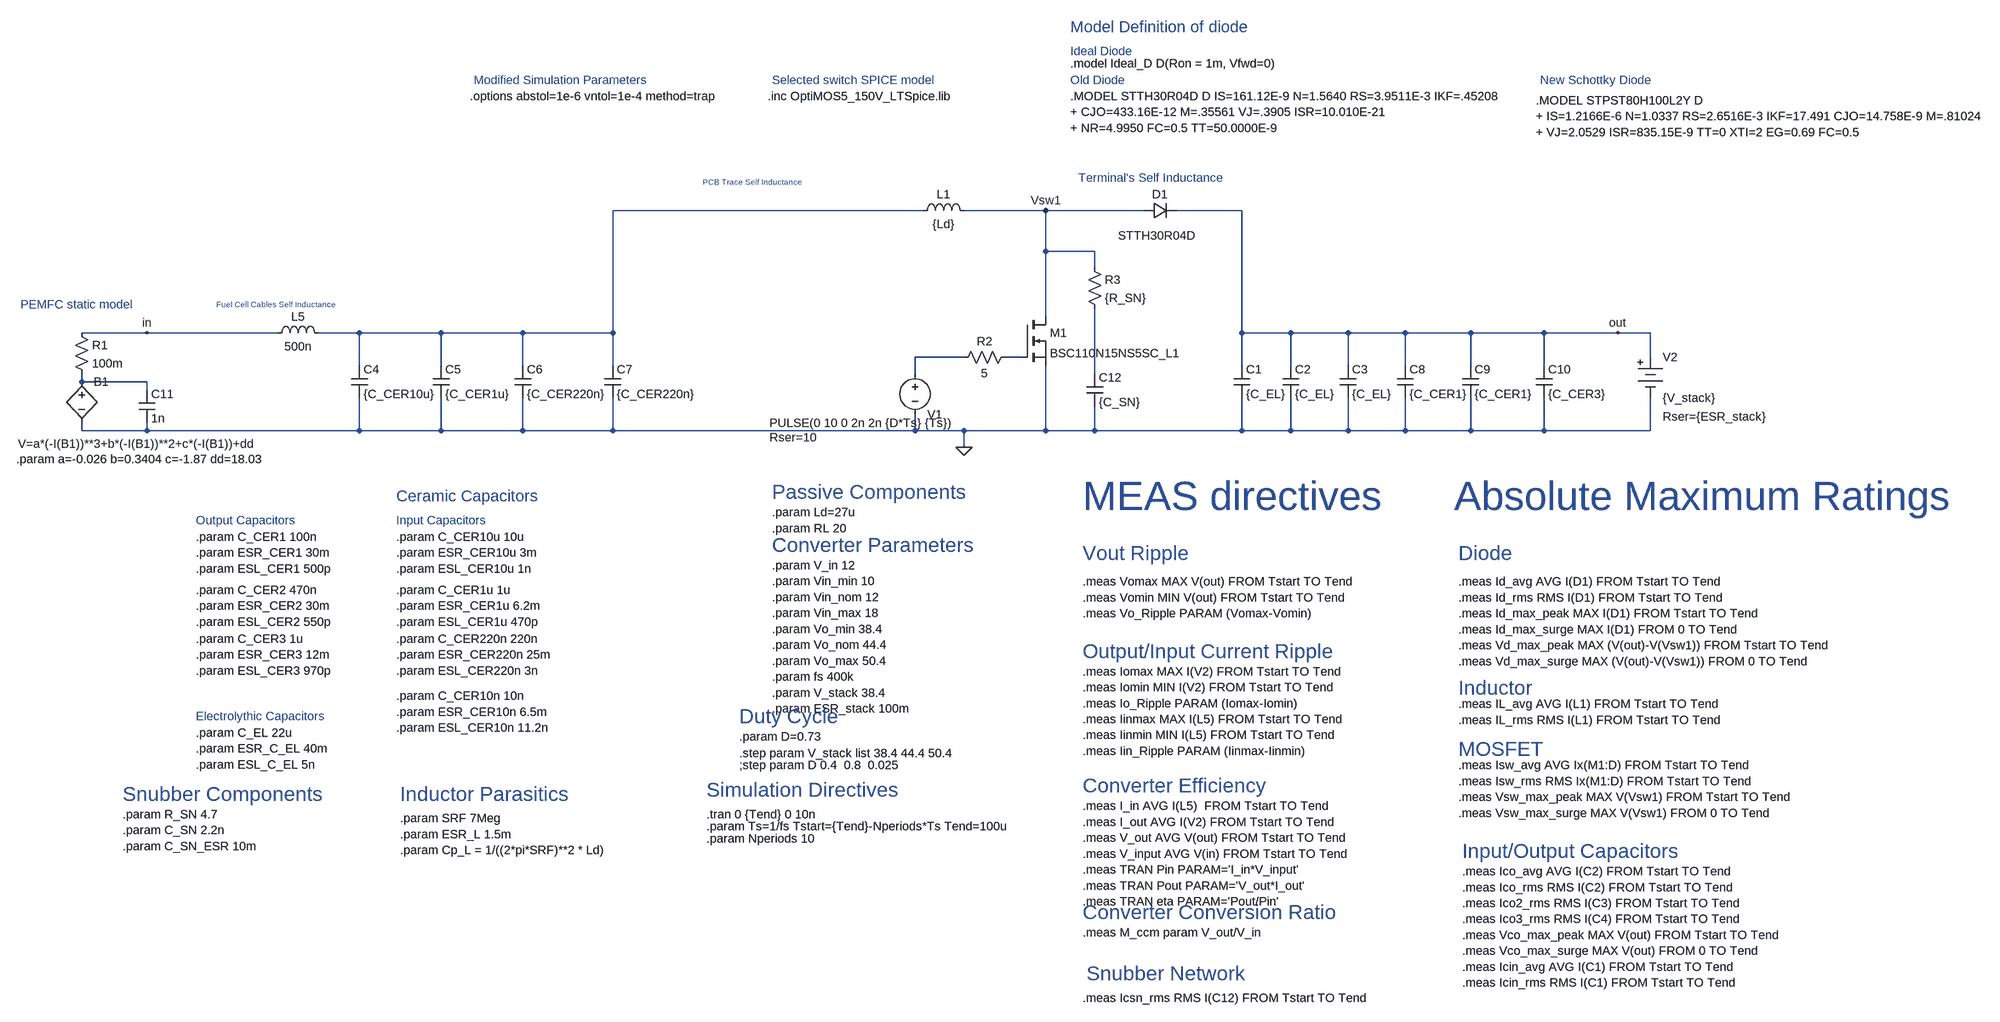
[diagram p0: schematic boost_snubber.asc]
boost_snubber.asc, the LTspice schematic file:
Version 4.1
SHEET 1 1944 1432
WIRE -208 -128 -816 -128
WIRE 32 -128 -128 -128
WIRE 224 -128 32 -128
WIRE 416 -128 288 -128
WIRE 32 -48 32 -128
WIRE 128 -48 32 -48
WIRE 128 -16 128 -48
WIRE 32 80 32 -48
WIRE -1728 112 -1856 112
WIRE -1472 112 -1728 112
WIRE -1312 112 -1392 112
WIRE -1152 112 -1312 112
WIRE -992 112 -1152 112
WIRE -816 112 -816 -128
WIRE -816 112 -992 112
WIRE 416 112 416 -128
WIRE 512 112 416 112
WIRE 624 112 512 112
WIRE 736 112 624 112
WIRE 864 112 736 112
WIRE 1008 112 864 112
WIRE 1152 112 1008 112
WIRE 1216 112 1152 112
WIRE -128 160 -224 160
WIRE -16 160 -48 160
WIRE 1216 160 1216 112
WIRE -1312 176 -1312 112
WIRE -1152 176 -1152 112
WIRE -992 176 -992 112
WIRE -816 176 -816 112
WIRE 416 176 416 112
WIRE 512 176 512 112
WIRE 624 176 624 112
WIRE 736 176 736 112
WIRE 864 176 864 112
WIRE 1008 176 1008 112
WIRE -224 192 -224 160
WIRE 128 192 128 64
WIRE -1856 208 -1856 192
WIRE -1728 208 -1856 208
WIRE -1728 224 -1728 208
WIRE -1856 304 -1856 288
WIRE -1728 304 -1728 288
WIRE -1728 304 -1856 304
WIRE -1312 304 -1312 240
WIRE -1312 304 -1728 304
WIRE -1152 304 -1152 240
WIRE -1152 304 -1312 304
WIRE -992 304 -992 240
WIRE -992 304 -1152 304
WIRE -816 304 -816 240
WIRE -816 304 -992 304
WIRE -224 304 -224 272
WIRE -224 304 -816 304
WIRE -128 304 -224 304
WIRE 32 304 32 176
WIRE 32 304 -128 304
WIRE 128 304 128 256
WIRE 128 304 32 304
WIRE 416 304 416 240
WIRE 416 304 128 304
WIRE 512 304 512 240
WIRE 512 304 416 304
WIRE 624 304 624 240
WIRE 624 304 512 304
WIRE 736 304 736 240
WIRE 736 304 624 304
WIRE 864 304 864 240
WIRE 864 304 736 304
WIRE 1008 304 1008 240
WIRE 1008 304 864 304
WIRE 1216 304 1216 240
WIRE 1216 304 1008 304
WIRE -128 336 -128 304
FLAG -128 336 0
FLAG 1152 112 out
FLAG 32 -128 Vsw1
FLAG -1728 112 in
SYMBOL ind -224 -112 R270
WINDOW 0 32 56 VTop 2
WINDOW 3 5 56 VBottom 2
SYMATTR InstName L1
SYMATTR Value {Ld}
SYMATTR SpiceLine Rser={ESR_L} Cpar={Cp_L}
SYMBOL diode 224 -112 R270
WINDOW 0 32 32 VTop 2
WINDOW 3 -18 25 VBottom 2
SYMATTR InstName D1
SYMATTR Value STTH30R04D
SYMBOL voltage -224 176 R0
WINDOW 0 24 96 Left 2
WINDOW 3 -285 113 Left 2
WINDOW 123 0 0 Left 0
WINDOW 39 -285 141 Left 2
SYMATTR InstName V1
SYMATTR Value PULSE(0 10 0 2n 2n {D*Ts} {Ts})
SYMATTR SpiceLine Rser=10
SYMBOL res -32 144 R90
WINDOW 0 0 56 VBottom 2
WINDOW 3 32 56 VTop 2
SYMATTR InstName R2
SYMATTR Value 5
SYMBOL cap 496 176 R0
SYMATTR InstName C2
SYMATTR Value {C_EL}
SYMATTR SpiceLine Rser={ESR_C_EL} Lser={ESL_C_EL}
SYMBOL cap 400 176 R0
SYMATTR InstName C1
SYMATTR Value {C_EL}
SYMATTR SpiceLine Rser={ESR_C_EL} Lser={ESL_C_EL}
SYMBOL cap 608 176 R0
SYMATTR InstName C3
SYMATTR Value {C_EL}
SYMATTR SpiceLine Rser={ESR_C_EL} Lser={ESL_C_EL}
SYMBOL cap -1328 176 R0
SYMATTR InstName C4
SYMATTR Value {C_CER10u}
SYMATTR SpiceLine Rser={ESR_CER10u} Lser={ESL_CER10u}
SYMBOL cap -1168 176 R0
SYMATTR InstName C5
SYMATTR Value {C_CER1u}
SYMATTR SpiceLine Rser={ESR_CER1u} Lser={ESL_CER1u}
SYMBOL cap -1008 176 R0
SYMATTR InstName C6
SYMATTR Value {C_CER220n}
SYMATTR SpiceLine Rser={ESR_CER220n} Lser={ESL_CER220n}
SYMBOL cap -832 176 R0
SYMATTR InstName C7
SYMATTR Value {C_CER220n}
SYMATTR SpiceLine Rser={ESR_CER220n} Lser={ESL_CER220n}
SYMBOL cap 720 176 R0
SYMATTR InstName C8
SYMATTR Value {C_CER1}
SYMATTR SpiceLine Rser={ESR_CER1} Lser={ESL_CER1}
SYMBOL cap 992 176 R0
SYMATTR InstName C10
SYMATTR Value {C_CER3}
SYMATTR SpiceLine Rser={ESR_CER3} Lser={ESL_CER3}
SYMBOL ind -1488 128 R270
WINDOW 0 32 56 VTop 2
WINDOW 3 5 56 VBottom 2
SYMATTR InstName L5
SYMATTR Value 500n
SYMBOL cap 848 176 R0
SYMATTR InstName C9
SYMATTR Value {C_CER1}
SYMATTR SpiceLine Rser={ESR_CER1} Lser={ESL_CER1}
SYMBOL Misc\\battery 1216 144 R0
WINDOW 123 0 0 Left 0
WINDOW 39 24 132 Left 2
SYMATTR SpiceLine Rser={ESR_stack}
SYMATTR InstName V2
SYMATTR Value {V_stack}
SYMBOL bv -1856 192 R0
WINDOW 3 -125 138 Left 2
SYMATTR Value V=a*(-I(B1))**3+b*(-I(B1))**2+c*(-I(B1))+dd
SYMATTR InstName B1
SYMBOL res -1872 96 R0
SYMATTR InstName R1
SYMATTR Value 100m
SYMBOL cap -1744 224 R0
SYMATTR InstName C11
SYMATTR Value 1n
SYMBOL res 112 -32 R0
SYMATTR InstName R3
SYMATTR Value {R_SN}
SYMBOL cap 112 192 R0
SYMATTR InstName C12
SYMATTR Value {C_SN}
SYMATTR SpiceLine Rser={C_SN_ESR}
SYMBOL nmos -16 80 R0
SYMATTR InstName M1
SYMATTR Value BSC110N15NS5SC_L1
SYMATTR Prefix X
TEXT -504 464 Left 2 !.param Ld=27u\n.param RL 20
TEXT -632 1056 Left 2 !.tran 0 {Tend} 0 10n
TEXT -632 1080 Left 2 !.param Ts=1/fs Tstart={Tend}-Nperiods*Ts Tend=100u
TEXT 80 -352 Left 2 !.MODEL STTH30R04D D IS=161.12E-9 N=1.5640 RS=3.9511E-3 IKF=.45208\n+ CJO=433.16E-12 M=.35561 VJ=.3905 ISR=10.010E-21\n+ NR=4.9950 FC=0.5 TT=50.0000E-9
TEXT 80 -488 Left 3 ;Model Definition of diode
TEXT -568 960 Left 2 !;step param D 0.4  0.8  0.025
TEXT -504 568 Left 2 !.param V_in 12\n.param Vin_min 10\n.param Vin_nom 12\n.param Vin_max 18\n.param Vo_min 38.4\n.param Vo_nom 44.4\n.param Vo_max 50.4\n.param fs 400k\n.param V_stack 38.4\n.param ESR_stack 100m
TEXT -504 424 Left 4 ;Passive Components
TEXT -504 528 Left 4 ;Converter Parameters
TEXT 840 600 Left 2 !.meas Id_avg AVG I(D1) FROM Tstart TO Tend\n.meas Id_rms RMS I(D1) FROM Tstart TO Tend\n.meas Id_max_peak MAX I(D1) FROM Tstart TO Tend\n.meas Id_max_surge MAX I(D1) FROM 0 TO Tend\n.meas Vd_max_peak MAX (V(out)-V(Vsw1)) FROM Tstart TO Tend\n.meas Vd_max_surge MAX (V(out)-V(Vsw1)) FROM 0 TO Tend
TEXT 832 432 Left 6 ;Absolute Maximum Ratings
TEXT 840 544 Left 4 ;Diode
TEXT 840 840 Left 2 !.meas IL_avg AVG I(L1) FROM Tstart TO Tend\n.meas IL_rms RMS I(L1) FROM Tstart TO Tend
TEXT 840 808 Left 4 ;Inductor
TEXT 840 960 Left 2 !.meas Isw_avg AVG Ix(M1:D) FROM Tstart TO Tend\n.meas Isw_rms RMS Ix(M1:D) FROM Tstart TO Tend\n.meas Vsw_max_peak MAX V(Vsw1) FROM Tstart TO Tend\n.meas Vsw_max_surge MAX V(Vsw1) FROM 0 TO Tend
TEXT 840 928 Left 4 ;MOSFET
TEXT 848 1168 Left 2 !.meas Ico_avg AVG I(C2) FROM Tstart TO Tend\n.meas Ico_rms RMS I(C2) FROM Tstart TO Tend\n.meas Ico2_rms RMS I(C3) FROM Tstart TO Tend\n.meas Ico3_rms RMS I(C4) FROM Tstart TO Tend\n.meas Vco_max_peak MAX V(out) FROM Tstart TO Tend\n.meas Vco_max_surge MAX V(out) FROM 0 TO Tend\n.meas Icin_avg AVG I(C1) FROM Tstart TO Tend\n.meas Icin_rms RMS I(C1) FROM Tstart TO Tend
TEXT 848 1128 Left 4 ;Input/Output Capacitors
TEXT -568 864 Left 4 ;Duty Cycle
TEXT 104 432 Left 6 ;MEAS directives
TEXT 104 544 Left 4 ;Vout Ripple
TEXT 104 600 Left 2 !.meas Vomax MAX V(out) FROM Tstart TO Tend\n.meas Vomin MIN V(out) FROM Tstart TO Tend\n.meas Vo_Ripple PARAM (Vomax-Vomin)
TEXT 104 736 Left 4 ;Output/Input Current Ripple
TEXT 104 776 Left 2 !.meas Iomax MAX I(V2) FROM Tstart TO Tend\n.meas Iomin MIN I(V2) FROM Tstart TO Tend\n.meas Io_Ripple PARAM (Iomax-Iomin)\n.meas Iinmax MAX I(L5) FROM Tstart TO Tend\n.meas Iinmin MIN I(L5) FROM Tstart TO Tend\n.meas Iin_Ripple PARAM (Iinmax-Iinmin)
TEXT 104 1040 Left 2 !.meas I_in AVG I(L5)  FROM Tstart TO Tend\n.meas I_out AVG I(V2) FROM Tstart TO Tend\n.meas V_out AVG V(out) FROM Tstart TO Tend\n.meas V_input AVG V(in) FROM Tstart TO Tend\n.meas TRAN Pin PARAM='I_in*V_input'\n.meas TRAN Pout PARAM='V_out*I_out'\n.meas TRAN eta PARAM='Pout/Pin'
TEXT 104 1000 Left 4 ;Converter Efficiency
TEXT 104 1248 Left 4 ;Converter Conversion Ratio
TEXT 104 1288 Left 2 !.meas M_ccm param V_out/V_in
TEXT -632 1008 Left 4 ;Simulation Directives
TEXT -1232 1016 Left 4 ;Inductor Parasitics
TEXT -632 1104 Left 2 !.param Nperiods 10
TEXT 80 -416 Left 2 !.model Ideal_D D(Ron = 1m, Vfwd=0)
TEXT -1240 432 Left 3 ;Ceramic Capacitors
TEXT -1632 896 Left 2 !.param C_EL 22u\n.param ESR_C_EL 40m\n.param ESL_C_EL 5n
TEXT -1632 864 Left 2 ;Electrolythic Capacitors
TEXT -1240 480 Left 2 ;Input Capacitors
TEXT -1240 512 Left 2 !.param C_CER10u 10u\n.param ESR_CER10u 3m\n.param ESL_CER10u 1n
TEXT -1240 616 Left 2 !.param C_CER1u 1u\n.param ESR_CER1u 6.2m\n.param ESL_CER1u 470p
TEXT -1240 712 Left 2 !.param C_CER220n 220n\n.param ESR_CER220n 25m\n.param ESL_CER220n 3n
TEXT -1240 824 Left 2 !.param C_CER10n 10n\n.param ESR_CER10n 6.5m\n.param ESL_CER10n 11.2n
TEXT -1632 512 Left 2 !.param C_CER1 100n\n.param ESR_CER1 30m\n.param ESL_CER1 500p
TEXT -1632 480 Left 2 ;Output Capacitors
TEXT -1632 616 Left 2 !.param C_CER2 470n\n.param ESR_CER2 30m\n.param ESL_CER2 550p
TEXT -1632 712 Left 2 !.param C_CER3 1u\n.param ESR_CER3 12m\n.param ESL_CER3 970p
TEXT -1232 1064 Left 2 !.param SRF 7Meg\n.param ESR_L 1.5m\n.param Cp_L = 1/((2*pi*SRF)**2 * Ld)
TEXT -640 -184 Left 1 ;PCB Trace Self Inductance
TEXT 96 -192 Left 2 ;Terminal's Self Inductance
TEXT -1592 56 Left 1 ;Fuel Cell Cables Self Inductance
TEXT 80 -384 Left 2 ;Old Diode
TEXT 1000 -384 Left 2 ;New Schottky Diode
TEXT 992 -344 Left 2 !.MODEL STPST80H100L2Y D\n+ IS=1.2166E-6 N=1.0337 RS=2.6516E-3 IKF=17.491 CJO=14.758E-9 M=.81024\n+ VJ=2.0529 ISR=835.15E-9 TT=0 XTI=2 EG=0.69 FC=0.5
TEXT -1096 -352 Left 2 !.options abstol=1e-6 vntol=1e-4 method=trap
TEXT -1088 -384 Left 2 ;Modified Simulation Parameters
TEXT -504 -384 Left 2 ;Selected switch SPICE model
TEXT 80 -440 Left 2 ;Ideal Diode
TEXT -568 936 Left 2 !.step param V_stack list 38.4 44.4 50.4
TEXT -1984 360 Left 2 !.param a=-0.026 b=0.3404 c=-1.87 dd=18.03
TEXT -568 904 Left 2 !.param D=0.73
TEXT -1976 56 Left 2 ;PEMFC static model
TEXT -512 -352 Left 2 !.inc OptiMOS5_150V_LTSpice.lib
TEXT -1776 1016 Left 4 ;Snubber Components
TEXT -1776 1056 Left 2 !.param R_SN 4.7\n.param C_SN 2.2n\n.param C_SN_ESR 10m
TEXT 112 1368 Left 4 ;Snubber Network
TEXT 104 1416 Left 2 !.meas Icsn_rms RMS I(C12) FROM Tstart TO Tend

The netlist it stands for:
* boost_snubber.asc
L1 N001 Vsw1 {Ld} Rser={ESR_L} Cpar={Cp_L}
D1 Vsw1 out STTH30R04D
V1 N002 0 PULSE(0 10 0 2n 2n {D*Ts} {Ts}) Rser=10
R2 N003 N002 5
C2 out 0 {C_EL} Rser={ESR_C_EL} Lser={ESL_C_EL}
C1 out 0 {C_EL} Rser={ESR_C_EL} Lser={ESL_C_EL}
C3 out 0 {C_EL} Rser={ESR_C_EL} Lser={ESL_C_EL}
C4 N001 0 {C_CER10u} Rser={ESR_CER10u} Lser={ESL_CER10u}
C5 N001 0 {C_CER1u} Rser={ESR_CER1u} Lser={ESL_CER1u}
C6 N001 0 {C_CER220n} Rser={ESR_CER220n} Lser={ESL_CER220n}
C7 N001 0 {C_CER220n} Rser={ESR_CER220n} Lser={ESL_CER220n}
C8 out 0 {C_CER1} Rser={ESR_CER1} Lser={ESL_CER1}
C10 out 0 {C_CER3} Rser={ESR_CER3} Lser={ESL_CER3}
L5 in N001 500n
C9 out 0 {C_CER1} Rser={ESR_CER1} Lser={ESL_CER1}
V2 out 0 {V_stack} Rser={ESR_stack}
B1 N005 0 V=a*(-I(B1))**3+b*(-I(B1))**2+c*(-I(B1))+dd
R1 in N005 100m
C11 N005 0 1n
R3 Vsw1 N004 {R_SN}
C12 N004 0 {C_SN} Rser={C_SN_ESR}
X§M1 Vsw1 N003 0 BSC110N15NS5SC_L1  ; pins D G S
.model D D
.lib standard.dio
.param Ld=27u
.param RL 20
.tran 0 {Tend} 0 10n
.param Ts=1/fs Tstart={Tend}-Nperiods*Ts Tend=100u
.MODEL STTH30R04D D IS=161.12E-9 N=1.5640 RS=3.9511E-3 IKF=.45208
+ CJO=433.16E-12 M=.35561 VJ=.3905 ISR=10.010E-21
+ NR=4.9950 FC=0.5 TT=50.0000E-9
* Model Definition of diode
;step param D 0.4  0.8  0.025
.param V_in 12
.param Vin_min 10
.param Vin_nom 12
.param Vin_max 18
.param Vo_min 38.4
.param Vo_nom 44.4
.param Vo_max 50.4
.param fs 400k
.param V_stack 38.4
.param ESR_stack 100m
* Passive Components
* Converter Parameters
.meas Id_avg AVG I(D1) FROM Tstart TO Tend
.meas Id_rms RMS I(D1) FROM Tstart TO Tend
.meas Id_max_peak MAX I(D1) FROM Tstart TO Tend
.meas Id_max_surge MAX I(D1) FROM 0 TO Tend
.meas Vd_max_peak MAX (V(out)-V(Vsw1)) FROM Tstart TO Tend
.meas Vd_max_surge MAX (V(out)-V(Vsw1)) FROM 0 TO Tend
* Absolute Maximum Ratings
* Diode
.meas IL_avg AVG I(L1) FROM Tstart TO Tend
.meas IL_rms RMS I(L1) FROM Tstart TO Tend
* Inductor
.meas Isw_avg AVG Ix(M1:D) FROM Tstart TO Tend
.meas Isw_rms RMS Ix(M1:D) FROM Tstart TO Tend
.meas Vsw_max_peak MAX V(Vsw1) FROM Tstart TO Tend
.meas Vsw_max_surge MAX V(Vsw1) FROM 0 TO Tend
* MOSFET
.meas Ico_avg AVG I(C2) FROM Tstart TO Tend
.meas Ico_rms RMS I(C2) FROM Tstart TO Tend
.meas Ico2_rms RMS I(C3) FROM Tstart TO Tend
.meas Ico3_rms RMS I(C4) FROM Tstart TO Tend
.meas Vco_max_peak MAX V(out) FROM Tstart TO Tend
.meas Vco_max_surge MAX V(out) FROM 0 TO Tend
.meas Icin_avg AVG I(C1) FROM Tstart TO Tend
.meas Icin_rms RMS I(C1) FROM Tstart TO Tend
* Input/Output Capacitors
* Duty Cycle
* MEAS directives
* Vout Ripple
.meas Vomax MAX V(out) FROM Tstart TO Tend
.meas Vomin MIN V(out) FROM Tstart TO Tend
.meas Vo_Ripple PARAM (Vomax-Vomin)
* Output/Input Current Ripple
.meas Iomax MAX I(V2) FROM Tstart TO Tend
.meas Iomin MIN I(V2) FROM Tstart TO Tend
.meas Io_Ripple PARAM (Iomax-Iomin)
.meas Iinmax MAX I(L5) FROM Tstart TO Tend
.meas Iinmin MIN I(L5) FROM Tstart TO Tend
.meas Iin_Ripple PARAM (Iinmax-Iinmin)
.meas I_in AVG I(L5)  FROM Tstart TO Tend
.meas I_out AVG I(V2) FROM Tstart TO Tend
.meas V_out AVG V(out) FROM Tstart TO Tend
.meas V_input AVG V(in) FROM Tstart TO Tend
.meas TRAN Pin PARAM='I_in*V_input'
.meas TRAN Pout PARAM='V_out*I_out'
.meas TRAN eta PARAM='Pout/Pin'
* Converter Efficiency
* Converter Conversion Ratio
.meas M_ccm param V_out/V_in
* Simulation Directives
* Inductor Parasitics
.param Nperiods 10
.model Ideal_D D(Ron = 1m, Vfwd=0)
* Ceramic Capacitors
.param C_EL 22u
.param ESR_C_EL 40m
.param ESL_C_EL 5n
* Electrolythic Capacitors
* Input Capacitors
.param C_CER10u 10u
.param ESR_CER10u 3m
.param ESL_CER10u 1n
.param C_CER1u 1u
.param ESR_CER1u 6.2m
.param ESL_CER1u 470p
.param C_CER220n 220n
.param ESR_CER220n 25m
.param ESL_CER220n 3n
.param C_CER10n 10n
.param ESR_CER10n 6.5m
.param ESL_CER10n 11.2n
.param C_CER1 100n
.param ESR_CER1 30m
.param ESL_CER1 500p
* Output Capacitors
.param C_CER2 470n
.param ESR_CER2 30m
.param ESL_CER2 550p
.param C_CER3 1u
.param ESR_CER3 12m
.param ESL_CER3 970p
.param SRF 7Meg
.param ESR_L 1.5m
.param Cp_L = 1/((2*pi*SRF)**2 * Ld)
* PCB Trace Self Inductance
* Terminal's Self Inductance
* Fuel Cell Cables Self Inductance
* Old Diode
* New Schottky Diode
.MODEL STPST80H100L2Y D
+ IS=1.2166E-6 N=1.0337 RS=2.6516E-3 IKF=17.491 CJO=14.758E-9 M=.81024
+ VJ=2.0529 ISR=835.15E-9 TT=0 XTI=2 EG=0.69 FC=0.5
.options abstol=1e-6 vntol=1e-4 method=trap
* Modified Simulation Parameters
* Selected switch SPICE model
* Ideal Diode
.step param V_stack list 38.4 44.4 50.4
.param a=-0.026 b=0.3404 c=-1.87 dd=18.03
.param D=0.73
* PEMFC static model
.inc OptiMOS5_150V_LTSpice.lib
* Snubber Components
.param R_SN 4.7
.param C_SN 2.2n
.param C_SN_ESR 10m
* Snubber Network
.meas Icsn_rms RMS I(C12) FROM Tstart TO Tend
.backanno
.end